# Altium project V3_Board.PrjPcb (part 8 of 9)

## Sheet Sensor_Section.SchDoc
size A4; DocumentNumber: 13; SheetNumber: 13; SheetTotal: 17
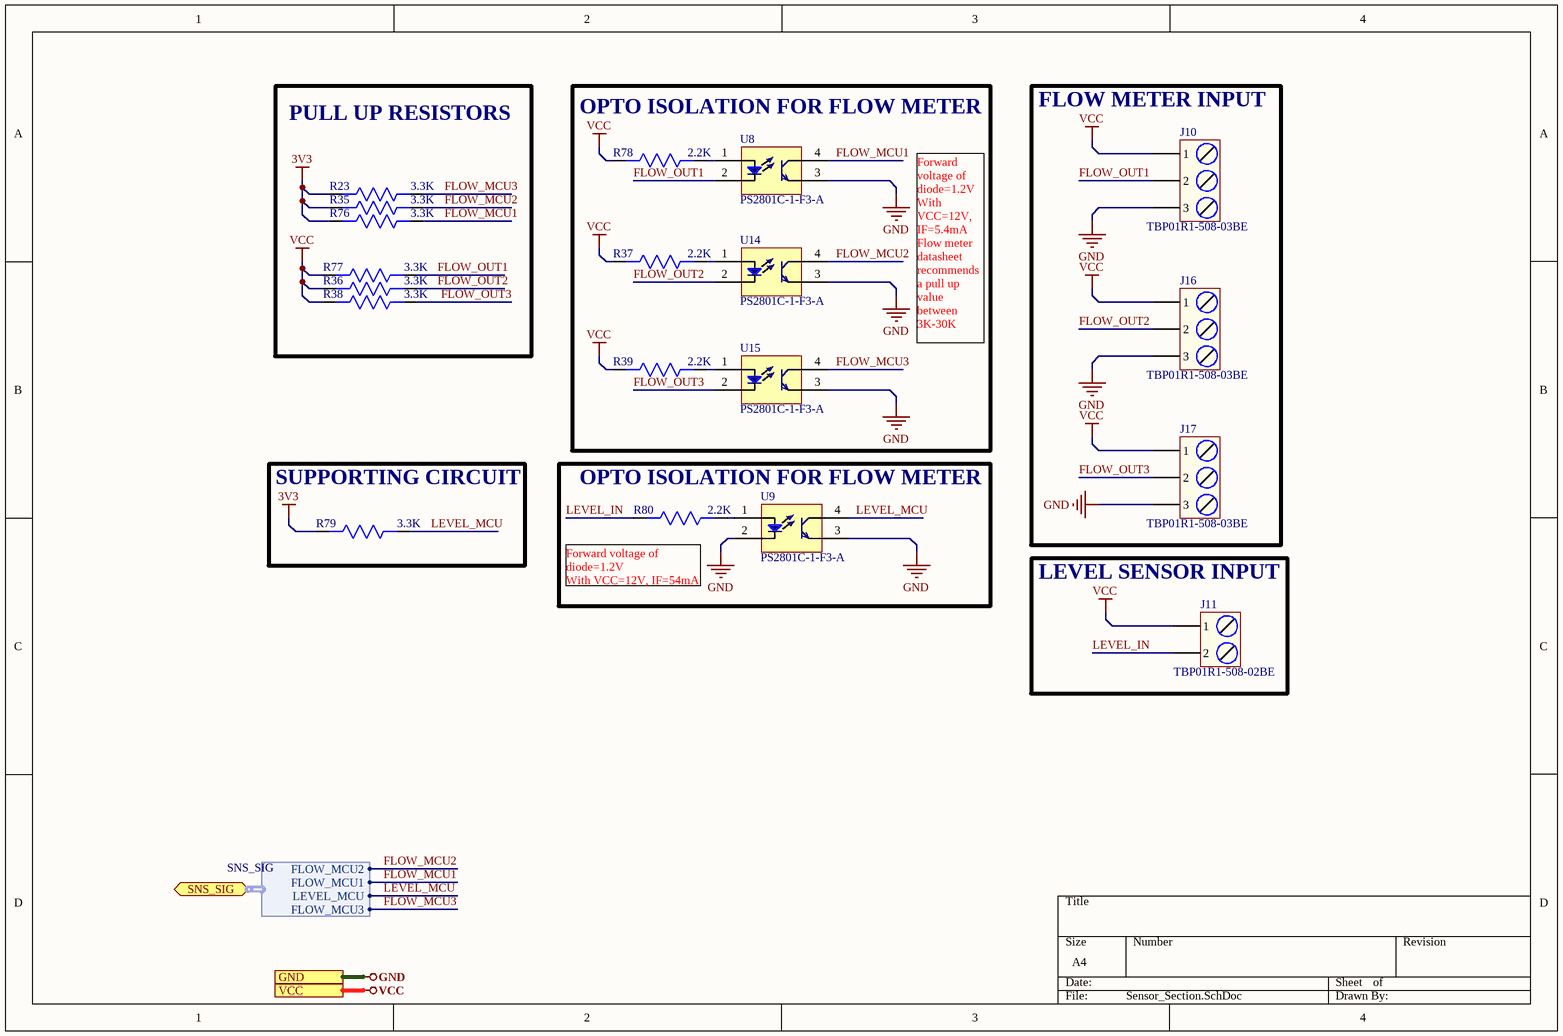
[diagram p15: Sensor_Section.SchDoc]

### Parts
J10  TBP01R1-508-03BE  [TBP01R1-508-03BE]
J11  TBP01R1-508-02BE  [TBP01R1-508-02BE]
J16  TBP01R1-508-03BE  [TBP01R1-508-03BE]
J17  TBP01R1-508-03BE  [TBP01R1-508-03BE]
R23  3.3K  [RES-0603]
R35  3.3K  [RES-0603]
R36  3.3K  [RES-0603]
R37  2.2K  [Res-0603]
R38  3.3K  [Res-0603]
R39  2.2K  [Res-0603]
R76  3.3K  [RES-0603]
R77  3.3K  [RES-0603]
R78  2.2K  [Res-0603]
R79  3.3K  [RES-0603]
R80  2.2K  [Res-0603]
U8  PS2801C-1-F3-A  [PS2801C-1-F3-A]
U9  PS2801C-1-F3-A  [PS2801C-1-F3-A]
U14  PS2801C-1-F3-A  [PS2801C-1-F3-A]
U15  PS2801C-1-F3-A  [PS2801C-1-F3-A]

### Blocks framed on the sheet
PULL UP RESISTORS: R23 R35 R36 R38 R76 R77
OPTO ISOLATION FOR FLOW METER: R37 R39 R78 U8 U14 U15
FLOW METER INPUT: J10 J16 J17
SUPPORTING CIRCUIT: R79
OPTO ISOLATION FOR FLOW METER: R80 U9
LEVEL SENSOR INPUT: J11

### Ports
GND, SNS_SIG (bidir, harness SNS_SIG), VCC

### Harnesses
SNS_SIG: FLOW_MCU1, LEVEL_MCU, FLOW_MCU2, FLOW_MCU3

### Nets
3V3: R23.2 R35.2 R76.2 R79.2
GND: J10.3 J16.3 J17.3 U8.3(E) U9.2(Ca) U9.3(E) U14.3(E) U15.3(E) ; port GND
VCC: J10.1 J11.1 J16.1 J17.1 R36.2 R37.2 R38.2 R39.2 R77.2 R78.2 ; port VCC
FLOW_MCU1: R76.1 U8.4(C) ; port SNS_SIG.FLOW_MCU1
FLOW_MCU2: R35.1 U14.4(C) ; port SNS_SIG.FLOW_MCU2
FLOW_MCU3: R23.1 U15.4(C) ; port SNS_SIG.FLOW_MCU3
FLOW_OUT1: J10.2 R77.1 U8.2(Ca)
FLOW_OUT2: J16.2 R36.1 U14.2(Ca)
FLOW_OUT3: J17.2 R38.1 U15.2(Ca)
LEVEL_IN: J11.2 R80.2
LEVEL_MCU: R79.1 U9.4(C) ; port SNS_SIG.LEVEL_MCU
NetR37_1: R37.1 U14.1(An)
NetR39_1: R39.1 U15.1(An)
NetR78_1: R78.1 U8.1(An)
NetR80_1: R80.1 U9.1(An)

### Notes on the sheet
- Forward voltage of diode=1.2V
  With VCC=12V, IF=5.4mA
  Flow meter datasheet recommends a pull up value between 3K-30K
- (near R80) Forward voltage of diode=1.2V
  With VCC=12V, IF=54mA

### Library data of the parts
J10 J16 J17 = TBP01R1-508-03BE: TERMINAL BLOCK, PLUGGABLE, 5.08,; Manufacturer: CUI Devices; Supplier 1: Arrow Electronics; Manufacturer Part Number: TBP01R1-508-03BE; RoHS: Yes; Category: Terminal Blocks; Stock 1: 2069; Pricing 1: 1=0.52380, 10=0.21370, 100=0.18450, 600=0.17070 (USD); Supplier Part Number 1: TBP01R1-508-03BE
J11 = TBP01R1-508-02BE: TERMINAL BLOCK, PLUGGABLE, 5.08,; Manufacturer: CUI Devices; Supplier 1: Arrow Electronics; Manufacturer Part Number: TBP01R1-508-02BE; RoHS: Yes; Category: Terminal Blocks; Stock 1: 1821; Pricing 1: 1=0.57450, 10=0.23530, 25=0.18730, 50=0.17170, 100=0.16040, 400=0.14010, 800=0.12060, 1200=0.11290 (USD); Supplier Part Number 1: TBP01R1-508-02BE
R23 R35 R36 R38 R76 R77 R79 = RC0603FR-073K3L: RES SMD 3.3K OHM 1% 1/10W 0603; Manufacturer: Yageo Phycomp; Temperature Coefficient: 100ppm/°C; Resistance: 3.3kR; Voltage Rating (DC): 50V; Power Rating: 100mW; Supplier 1: Digi-Key; Manufacturer Part Number: RC0603FR-073K3L; Stock 1: 6863000; Pricing 1: 1=0.1, 10=0.024, 100=0.0097, 1000=0.00437, 2500=0.00379 (USD); Mount: Surface Mount; Case/Package: 0603; Number of Pins: 2; Min Operating Temperature: -55°C; Max Operating Temperature: 155°C; Tolerance: 1%; Packaging: Cut Tape; Length: 1.6mm; Height: 0.45mm; Width: 800um; Depth: 0.8mm; REACH SVHC: No SVHC; Lead Free: Lead Free; Supplier Part Number 1: 311-3.30KHRCT-ND
  R38: LCSC Part Number: C108078
R37 R39 R78 R80 = RC0603FR-072K2L: RES 2.2K OHM 1% 1/10W 0603; Manufacturer: Yageo; Resistance: 2.2kR; Temperature Coefficient: 100ppm/°C; Power Rating: 100mW; Voltage Rating: 50V; Supplier 1: Digi-Key; Manufacturer Part Number: RC0603FR-072K2L; RoHS: Yes; Category: Chip SMD Resistors; Stock 1: 2808901; Pricing 1: 1=0.10000, 10=0.02100, 100=0.00850, 1000=0.00383, 2500=0.00332 (USD); Case/Package: 0603; Case Code (Imperial): 0603; Case Code (Metric): 1608; Size Code: 0603; Min Operating Temperature: -55°C; Max Operating Temperature: 155°C; Tolerance: 1%; Packaging: Tape and Reel; Resistor Type: Thick Film; Package Quantity: 1; Termination: SMD/SMT; Number of Terminations: 2; Max Power Dissipation: 100mW; Features: Moisture Resistant; Series: RC; Resistance Tolerance: 1%; Construction: Rectangular; Length: 1.6mm; Width: 0.031inch; Height: 0.022inch; Depth: 0.8mm; Lead Free: Lead Free; Military Standard: Not; RoHS Compliant: Yes; Supplier Part Number 1: 311-2.20KHRCT-ND
U8 U9 U14 U15 = PS2801C-1-F3-A: TransistorOptocouplers DC 1 2500Vrms SOP-4_P1.27 Optocouplers RoHS; Manufacturer: CEL; Number of Channels: 1; Collector Emitter Voltage (VCEO): 300mV; Forward Voltage: 1.2V; Max Power Dissipation: 120mW; Max Collector Current: 30mA; Max Output Voltage: 80V; Supplier 1: Digi-Key; Manufacturer Part Number: PS2801C-1-F3-A; Stock 1: 399; Pricing 1: 1=0.77, 10=0.595, 100=0.3825 (USD); Mount: Surface Mount; Case/Package: SOIC; Number of Pins: 4; Min Operating Temperature: -55°C; Max Operating Temperature: 100°C; Packaging: Tape and Reel; Collector Emitter Saturation Voltage: 300mV; Package Quantity: 1; Output Current per Channel: 30mA; Lead Free: Lead Free; ComponentLink1URL: http://www.cel.com/pdf/datasheets/PS2801C-1,PS2801C-4.pdf?src-supplier=Digi-Key; ComponentLink1Description: http://www.cel.com/pdf/datasheets/PS2801C-1,PS2801C-4.pdf?src-supplier=Digi-Key; ComponentLink2URL: http://www.cel.com/pdf/datasheets/how_to_order_optos.pdf?src-supplier=Digi-Key; ComponentLink2Description: http://www.cel.com/pdf/datasheets/how_to_order_optos.pdf?src-supplier=Digi-Key; ComponentLink3URL: http://datasheet.iiic.cc/cel/PS2801C-1-F3-A.pdf?src-supplier=IIIC; ComponentLink3Description: http://datasheet.iiic.cc/cel/PS2801C-1-F3-A.pdf?src-supplier=IIIC; Supplier Part Number 1: PS2801C-1-F3-ACT-ND

## Sheet LED_Section.SchDoc
size A4; DocumentNumber: 14; SheetNumber: 14; SheetTotal: 17
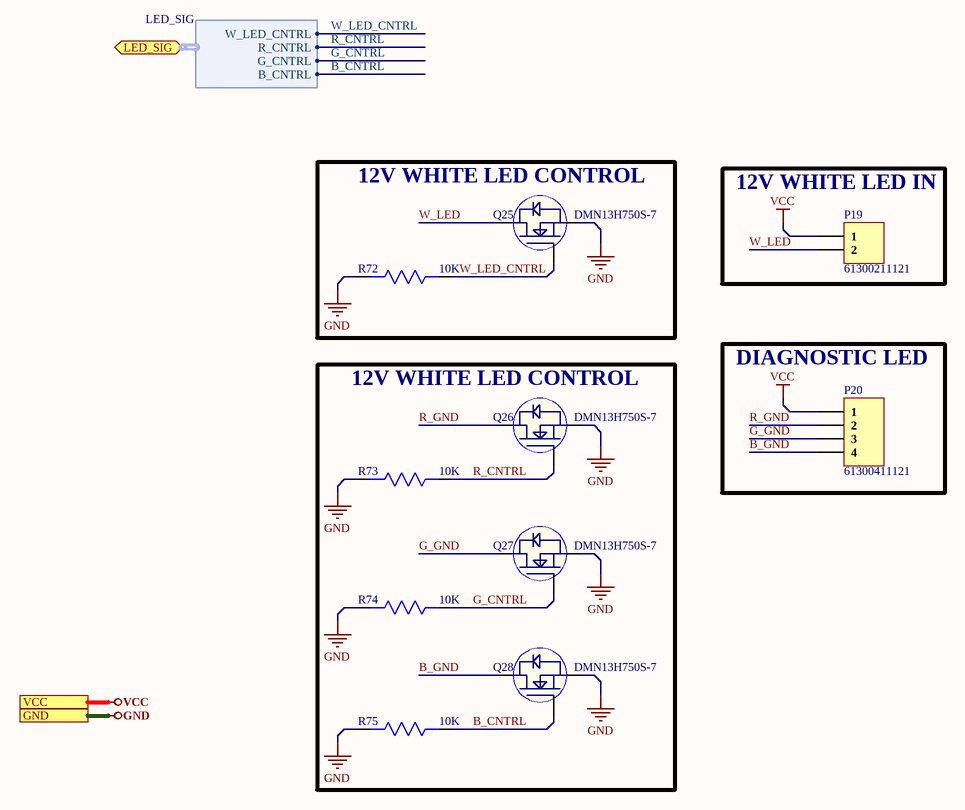
[diagram p16: LED_Section.SchDoc]

### Parts
P19  61300211121  [HDR1X2]
P20  61300411121  [HDR1X4]
Q25  DMN13H750S-7  [SOT23-3]
Q26  DMN13H750S-7  [SOT23-3]
Q27  DMN13H750S-7  [SOT23-3]
Q28  DMN13H750S-7  [SOT23-3]
R72  10K  [Res-0603]
R73  10K  [Res-0603]
R74  10K  [RES-0603]
R75  10K  [Res-0603]

### Blocks framed on the sheet
12V WHITE LED CONTROL: Q25 R72
12V WHITE LED IN: P19
12V WHITE LED CONTROL: Q26-Q28 R73-R75
DIAGNOSTIC LED: P20

### Ports
GND, LED_SIG (bidir, harness LED_SIG), VCC

### Harnesses
LED_SIG: R_CNTRL, G_CNTRL, B_CNTRL, W_LED_CNTRL

### Nets
GND: Q25.2(S) Q26.2(S) Q27.2(S) Q28.2(S) R72.2 R73.2 R74.2 R75.2 ; port GND
VCC: P19.1 P20.1 ; port VCC
B_CNTRL: Q28.1(G) R75.1 ; port LED_SIG.B_CNTRL
B_GND: P20.4 Q28.3(D)
G_CNTRL: Q27.1(G) R74.1 ; port LED_SIG.G_CNTRL
G_GND: P20.3 Q27.3(D)
R_CNTRL: Q26.1(G) R73.1 ; port LED_SIG.R_CNTRL  [project net LED_SIG.R_CNTRL]
R_GND: P20.2 Q26.3(D)
W_LED: P19.2 Q25.3(D)
W_LED_CNTRL: Q25.1(G) R72.1 ; port LED_SIG.W_LED_CNTRL  [project net LED_SIG.W_LED_CNTRL]

### Library data of the parts
P19 = Header 1x2: CONN HEADER VERT 2POS 2.54MM; Manufacturer: Wurth Electronics; Current Rating: 3A; Voltage Rating: 250V; Number of Positions: 2; Gender: Male; Connector Type: Male Pin; Pitch: 0.1inch; Supplier 1: Digi-Key; Manufacturer Part Number: 61300211121; Stock 1: 219205; Pricing 1: 1=0.13, 10=0.106, 25=0.088, 50=0.074, 100=0.067, 1000=0.061 (USD); Mount: Through Hole; Contact Plating: Gold; Housing Material: PBT; Contact Material: Copper Alloy,Copper; Color: Black; Min Operating Temperature: -40°C; Max Operating Temperature: 125°C; Number of Rows: 1; Contact Gender: Male; Packaging: Bulk; Termination: Through Hole; Number of Contacts: 2; Contact Mating Length: 0.236inch; REACH SVHC: Unknown; Lead Free: Lead Free; ComponentLink1URL: http://www.mouser.com/ds/2/445/6130xx11121-538006.pdf?src-supplier=Mouser; ComponentLink1Description: http://www.mouser.com/ds/2/445/6130xx11121-538006.pdf?src-supplier=Mouser; Supplier Part Number 1: 732-5315-ND
P20 = Header 1x4: CONN HEADER VERT 4POS 2.54MM; Manufacturer: Wurth Electronics; Number of Positions: 4; Gender: Male; Connector Type: Male Pin; Pitch: 0.1inch; Supplier 1: Digi-Key; Manufacturer Part Number: 61300411121; Stock 1: 20544; Pricing 1: 1=0.18, 10=0.153, 25=0.1272, 50=0.106, 100=0.096, 1000=0.088 (USD); Mount: Through Hole; Contact Plating: Gold; Contact Material: Copper; Color: Black; Number of Rows: 1; Packaging: Bulk; Termination: Solder; Number of Contacts: 4; Contact Mating Length: 0.236inch; REACH SVHC: Unknown; Lead Free: Lead Free; ComponentLink1URL: http://www.farnell.com/cad/1737268.pdf?src-supplier=Element14; ComponentLink1Description: http://www.farnell.com/cad/1737268.pdf?src-supplier=Element14; ComponentLink2URL: https://katalog.we-online.de/em/datasheet/6130xx11121.pdf?src-supplier=Digi-Key; ComponentLink2Description: https://katalog.we-online.de/em/datasheet/6130xx11121.pdf?src-supplier=Digi-Key; Supplier Part Number 1: 732-5317-ND
Q25-Q28 = DMN13H750S-7: MOSFET N-CH 130V 1A SOT23; Manufacturer: Diodes; Rds On Max: 750mR; Input Capacitance: 231pF; Max Power Dissipation: 770mW; Supplier 1: Digi-Key; Manufacturer Part Number: DMN13H750S-7; Stock 1: 5815; Pricing 1: 1=0.53, 10=0.455, 25=0.4244, 100=0.3151, 250=0.29936, 500=0.24604, 1000=0.19998 (USD); Mount: Surface Mount; Case/Package: TO-236-3; Min Operating Temperature: -55°C; Max Operating Temperature: 150°C; Packaging: Tape and Reel; Drain to Source Voltage (Vdss): 130V; Continuous Drain Current (ID): 1A; ComponentLink1URL: https://www.diodes.com/assets/Datasheets/DMN13H750S.pdf?src-supplier=Digi-Key; ComponentLink1Description: https://www.diodes.com/assets/Datasheets/DMN13H750S.pdf?src-supplier=Digi-Key; ComponentLink2URL: http://www.mouser.com/ds/2/115/DMN13H750S-526254.pdf?src-supplier=Mouser; ComponentLink2Description: http://www.mouser.com/ds/2/115/DMN13H750S-526254.pdf?src-supplier=Mouser; Supplier Part Number 1: DMN13H750S-7DICT-ND
R72 R73 R75 = RC0603FR-0710KL: RES SMD 10K Ohm 1% 1/10W 0603; Manufacturer: Yageo; Voltage Rating: 75V; Resistance: 10kR; Power Rating: 100mW; Temperature Coefficient: 100ppm/°C; Voltage Rating (DC): 50V; Supplier 1: Digi-Key; Manufacturer Part Number: RC0603FR-0710KL; RoHS: Yes; Category: Chip SMD Resistors; Stock 1: 25249139; Pricing 1: 1=0.10000, 10=0.02400, 100=0.00970, 1000=0.00436, 2500=0.00378 (USD); Case/Package: 0603; Case Code (Imperial): 0603; Case Code (Metric): 1608; Size Code: 0603; Min Operating Temperature: -55°C; Max Operating Temperature: 155°C; Packaging: Tape and Reel; Tolerance: 1%; Resistor Type: Thick Film; Termination: SMD/SMT; Number of Terminations: 2; Max Power Dissipation: 100mW; Features: Moisture Resistant; Series: RC; Construction: Rectangular; Length: 1.6mm; Width: 0.8mm; Height: 0.45mm; Depth: 0.8mm; Military Standard: Not; Lead Free: Lead Free; RoHS Compliant: Yes; ComponentLink1URL: https://datasheet.ciiva.com/7660/38590-7660789.pdf?src-supplier=Element14; ComponentLink1Description: https://datasheet.ciiva.com/7660/38590-7660789.pdf?src-supplier=Element14; Supplier Part Number 1: 311-10.0KHRCT-ND; Number of Pins: 2; Weight: 7.1E-05oz; Resistance Tolerance: 1%; Lead Pitch: 0.3mm; REACH SVHC: Unknown; ComponentLink2URL: https://datasheet.ciiva.com/7983/443971-7983596.pdf?src-supplier=Element14; ComponentLink2Description: https://datasheet.ciiva.com/7983/443971-7983596.pdf?src-supplier=Element14; ComponentLink3URL: https://datasheet.ciiva.com/22747/443971-22747519.pdf?src-supplier=Element14; ComponentLink3Description: https://datasheet.ciiva.com/22747/443971-22747519.pdf?src-supplier=Element14; ComponentLink4URL: https://datasheet.ciiva.com/46440/1868787-46440891.pdf?src-supplier=Element14; ComponentLink4Description: https://datasheet.ciiva.com/46440/1868787-46440891.pdf?src-supplier=Element14; ComponentLink5URL: https://datasheet.ciiva.com/7746/1738695-7746239.pdf?src-supplier=Element14; ComponentLink5Description: https://datasheet.ciiva.com/7746/1738695-7746239.pdf?src-supplier=Element14; ComponentLink6URL: https://datasheet.ciiva.com/15189/getdatasheetpartid-409289-15189591.pdf?src-supplier=Verical; ComponentLink6Description: https://datasheet.ciiva.com/15189/getdatasheetpartid-409289-15189591.pdf?src-supplier=Verical; LCSC Part Number: C98220
R74 = AC0603JR-0710KL: RES SMD 10K OHM 5% 1/10W 0603; Manufacturer: Yageo; Voltage Rating: 50V; Resistance: 10kR; Power Rating: 100mW; Temperature Coefficient: 100ppm/°C; Supplier 1: Future Electronics; Manufacturer Part Number: AC0603JR-0710KL; RoHS: Yes; Category: Chip SMD Resistors; Stock 1: 1533000; Pricing 1: 5000=0.00540 (USD); Case/Package: 0603; Case Code (Imperial): 0603; Case Code (Metric): 1608; Size Code: 0603; Min Operating Temperature: -55°C; Max Operating Temperature: 155°C; Packaging: Tape and Reel; Tolerance: 5%; Package Quantity: 1; Resistor Type: Thick Film; Termination: SMD/SMT; Number of Terminations: 2; Max Power Dissipation: 100mW; Features: Moisture Resistant,Automotive AEC-Q200,Anti-Sulfur; Series: AC; Construction: Rectangular; Length: 0.063inch; Width: 0.031inch; Height: 0.022inch; Depth: 0.8mm; Military Standard: Not; Lead Free: Lead Free; RoHS Compliant: Yes; ComponentLink1URL: https://datasheet.ciiva.com/5562/pyu-ac-51-rohs-l-2-5562553.pdf?src-supplier=Mouser; ComponentLink1Description: https://datasheet.ciiva.com/5562/pyu-ac-51-rohs-l-2-5562553.pdf?src-supplier=Mouser; Supplier Part Number 1: 1029044

## Sheet Valve_Section.SchDoc
size A; DocumentNumber: 12; SheetNumber: 12; SheetTotal: 17
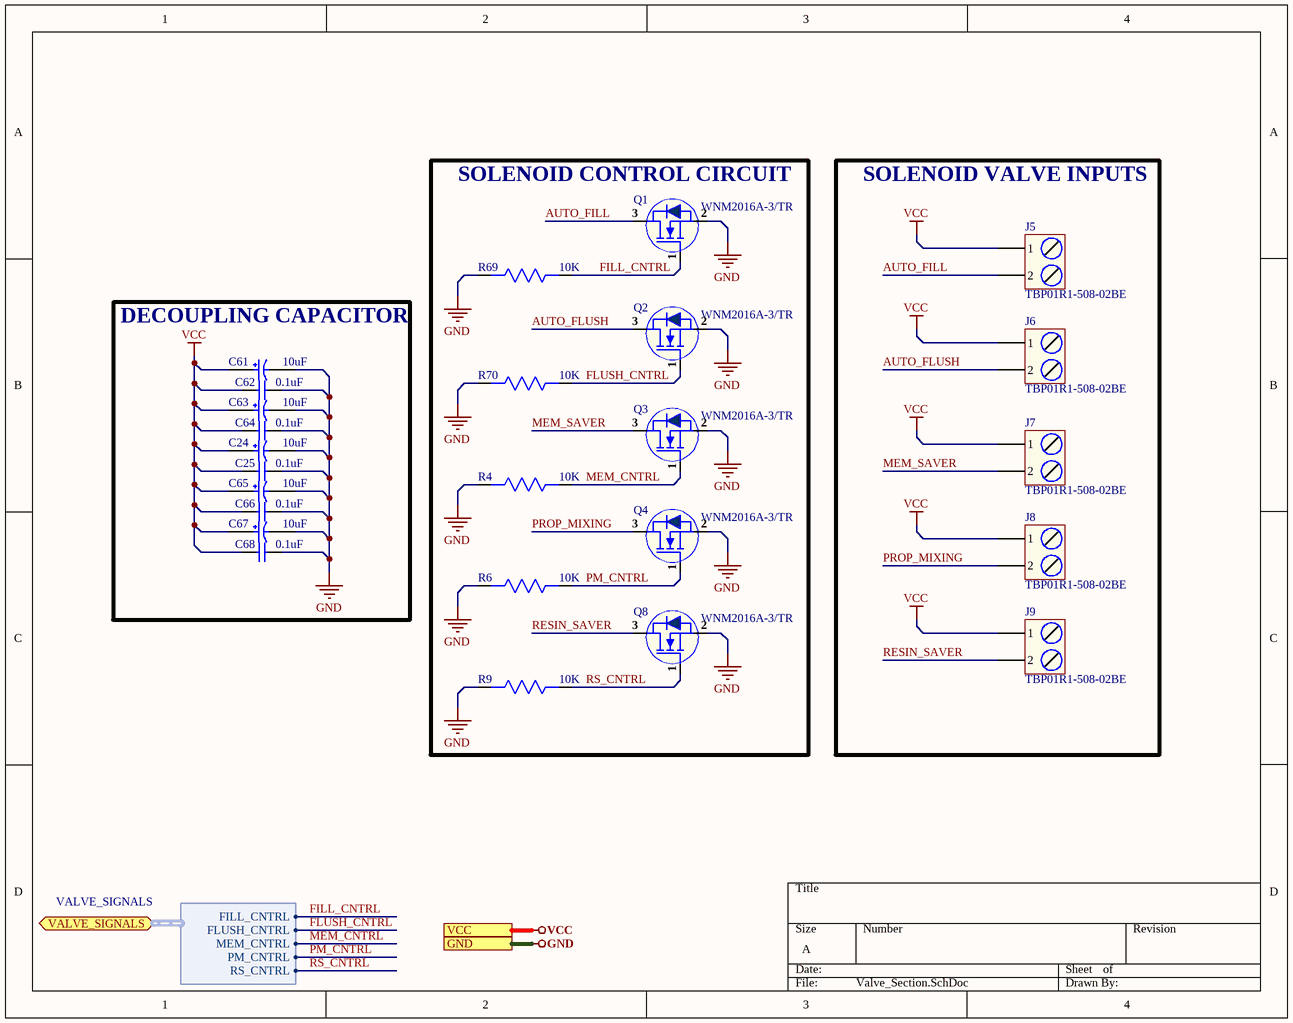
[diagram p17: Valve_Section.SchDoc]

### Parts
C24  10uF  [RVT1E100M0405.]
C25  0.1uF  [Cap0603]
C61  10uF  [RVT1E100M0405.]
C62  0.1uF  [Cap0603]
C63  10uF  [RVT1E100M0405.]
C64  0.1uF  [Cap0603]
C65  10uF  [RVT1E100M0405.]
C66  0.1uF  [Cap0603]
C67  10uF  [RVT1E100M0405.]
C68  0.1uF  [Cap0603]
J5  TBP01R1-508-02BE  [TBP01R1-508-02BE]
J6  TBP01R1-508-02BE  [TBP01R1-508-02BE]
J7  TBP01R1-508-02BE  [TBP01R1-508-02BE]
J8  TBP01R1-508-02BE  [TBP01R1-508-02BE]
J9  TBP01R1-508-02BE  [TBP01R1-508-02BE]
Q1  WNM2016A-3/TR  [sot-23]
Q2  WNM2016A-3/TR  [sot-23]
Q3  WNM2016A-3/TR  [sot-23]
Q4  WNM2016A-3/TR  [sot-23]
Q8  WNM2016A-3/TR  [sot-23]
R4  10K  [Res-0603]
R6  10K  [Res-0603]
R9  10K  [Res-0603]
R69  10K  [Res-0603]
R70  10K  [Res-0603]

### Blocks framed on the sheet
SOLENOID CONTROL CIRCUIT: Q1-Q4 Q8 R4 R6 R9 R69 R70
SOLENOID VALVE INPUTS: J5-J9
DECOUPLING CAPACITOR: C24 C25 C61-C68

### Ports
GND, VALVE_SIGNALS (bidir, harness VALVE_SIGNALS), VCC

### Harnesses
VALVE_SIGNALS: FILL_CNTRL, FLUSH_CNTRL, MEM_CNTRL, PM_CNTRL, RS_CNTRL

### Nets
GND: C24.2 C25.2 C61.2 C62.2 C63.2 C64.2 C65.2 C66.2 C67.2 C68.2 Q1.2(S) Q2.2(S) Q3.2(S) Q4.2(S) Q8.2(S) R4.2 R6.2 R9.2 R69.2 R70.2 ; port GND
VCC: C24.1 C25.1 C61.1 C62.1 C63.1 C64.1 C65.1 C66.1 C67.1 C68.1 J5.1 J6.1 J7.1 J8.1 J9.1 ; port VCC
AUTO_FILL: J5.2 Q1.3(D)
AUTO_FLUSH: J6.2 Q2.3(D)
FILL_CNTRL: Q1.1(G) R69.1 ; port VALVE_SIGNALS.FILL_CNTRL
FLUSH_CNTRL: Q2.1(G) R70.1 ; port VALVE_SIGNALS.FLUSH_CNTRL
MEM_CNTRL: Q3.1(G) R4.1 ; port VALVE_SIGNALS.MEM_CNTRL
MEM_SAVER: J7.2 Q3.3(D)
PM_CNTRL: Q4.1(G) R6.1 ; port VALVE_SIGNALS.PM_CNTRL
PROP_MIXING: J8.2 Q4.3(D)
RESIN_SAVER: J9.2 Q8.3(D)
RS_CNTRL: Q8.1(G) R9.1 ; port VALVE_SIGNALS.RS_CNTRL

### Library data of the parts
C24 C61 C63 C65 C67 = RVT1E100M0405: CAP ALUM 10uF 25V SMD; Manufacturer: ROQANG; φD: 4mm; L: 5.4mm; Tolerance: ±20%; Operating Temperature: -45℃~+105℃; Rated Voltage: 25V; Capacitance: 10uF
C25 C62 C64 C66 C68 = CC0603ZRY5V9BB104: as C27-C30 on sheet Controller_Section; Supplier 1: Digi-Key; Manufacturer Part Number: CC0603ZRY5V9BB104; Stock 1: 15000880; Pricing 1: 1=0.1, 10=0.075, 100=0.0334, 500=0.02386, 1000=0.01874 (USD); Mount: Surface Mount; Case/Package: 0603; Number of Pins: 2; Case Code (Metric): 1608; Case Code (Imperial): 0603; Min Operating Temperature: -30°C; Max Operating Temperature: 85°C; Dielectric: Y5V; Voltage Rating: 50V; Package Quantity: 1; Packaging: Tape and Reel; Voltage Rating (DC): 50V; Termination: SMD/SMT; Composition: Ceramic; Voltage: 50V; Length: 1.6mm; Height: 0.8mm; Width: 0.031inch; Thickness: 0.035inch; Depth: 0.8mm; Radiation Hardening: No; REACH SVHC: No SVHC; Lead Free: Lead Free; Halogen Free: Halogen Free; ComponentLink1URL: http://www.yageo.com/documents/recent/UPY-GPHC_Y5V_6.3V-to-50V_8.pdf?src-supplier=Digi-Key; ComponentLink1Description: http://www.yageo.com/documents/recent/UPY-GPHC_Y5V_6.3V-to-50V_8.pdf?src-supplier=Digi-Key; ComponentLink2URL: http://www.yageo.com/documents/recent/UPY-GPHC_Y5V_6.3V-to-50V_5.pdf?src-supplier=Avnet+Europe; ComponentLink2Description: http://www.yageo.com/documents/recent/UPY-GPHC_Y5V_6.3V-to-50V_5.pdf?src-supplier=Avnet+Europe; ComponentLink3URL: https://www.verical.com/server-webapp/html/getDatasheet?partID=403611&src-supplier=Verical; ComponentLink3Description: https://www.verical.com/server-webapp/html/getDatasheet?partID=403611&src-supplier=Verical; ComponentLink4URL: http://www.mouser.com/ds/2/447/Yageo_UPY-GP_NP0_16V-to-50V_9-358835.pdf?src-supplier=Mouser; ComponentLink4Description: http://www.mouser.com/ds/2/447/Yageo_UPY-GP_NP0_16V-to-50V_9-358835.pdf?src-supplier=Mouser; ComponentLink5URL: http://www.farnell.com/datasheets/1132289.pdf?src-supplier=Element14; ComponentLink5Description: http://www.farnell.com/datasheets/1132289.pdf?src-supplier=Element14; Supplier Part Number 1: 311-1343-1-ND
J5-J9 = TBP01R1-508-02BE: as J11 on sheet Sensor_Section; Supplier 1: Arrow Electronics; Manufacturer Part Number: TBP01R1-508-02BE; RoHS: Yes; Category: Terminal Blocks; Stock 1: 1821; Pricing 1: 1=0.57450, 10=0.23530, 25=0.18730, 50=0.17170, 100=0.16040, 400=0.14010, 800=0.12060, 1200=0.11290 (USD); Supplier Part Number 1: TBP01R1-508-02BE
Q1-Q4 Q8 = WNM2016A-3/TR: Single N-Channel, 20V, 4.7A, Power MOSFET; Manufacturer: WILLSEMI; Manufacturer Part Number: WNM2016A-3/TR; Footprint: SOT-23-3; ComponentLink1Description: LCSC; ComponentLink1URL: https://www.lcsc.com/product-detail/MOSFETs_WILLSEMI-Will-Semicon-WNM2016A-3-TR_C601105.html; LCSC Part Number: C601105; Item Type: Mosfet
R4 R6 R9 R69 R70 = RC0603FR-0710KL: as R72 on sheet LED_Section; Supplier 1: Digi-Key; Manufacturer Part Number: RC0603FR-0710KL; RoHS: Yes; Category: Chip SMD Resistors; Stock 1: 25249139; Pricing 1: 1=0.10000, 10=0.02400, 100=0.00970, 1000=0.00436, 2500=0.00378 (USD); Case/Package: 0603; Case Code (Imperial): 0603; Case Code (Metric): 1608; Size Code: 0603; Min Operating Temperature: -55°C; Max Operating Temperature: 155°C; Packaging: Tape and Reel; Tolerance: 1%; Resistor Type: Thick Film; Termination: SMD/SMT; Number of Terminations: 2; Max Power Dissipation: 100mW; Features: Moisture Resistant; Series: RC; Construction: Rectangular; Length: 1.6mm; Width: 0.8mm; Height: 0.45mm; Depth: 0.8mm; Military Standard: Not; Lead Free: Lead Free; RoHS Compliant: Yes; ComponentLink1URL: https://datasheet.ciiva.com/7660/38590-7660789.pdf?src-supplier=Element14; ComponentLink1Description: https://datasheet.ciiva.com/7660/38590-7660789.pdf?src-supplier=Element14; Supplier Part Number 1: 311-10.0KHRCT-ND; Number of Pins: 2; Weight: 7.1E-05oz; Resistance Tolerance: 1%; Lead Pitch: 0.3mm; REACH SVHC: Unknown; ComponentLink2URL: https://datasheet.ciiva.com/7983/443971-7983596.pdf?src-supplier=Element14; ComponentLink2Description: https://datasheet.ciiva.com/7983/443971-7983596.pdf?src-supplier=Element14; ComponentLink3URL: https://datasheet.ciiva.com/22747/443971-22747519.pdf?src-supplier=Element14; ComponentLink3Description: https://datasheet.ciiva.com/22747/443971-22747519.pdf?src-supplier=Element14; ComponentLink4URL: https://datasheet.ciiva.com/46440/1868787-46440891.pdf?src-supplier=Element14; ComponentLink4Description: https://datasheet.ciiva.com/46440/1868787-46440891.pdf?src-supplier=Element14; ComponentLink5URL: https://datasheet.ciiva.com/7746/1738695-7746239.pdf?src-supplier=Element14; ComponentLink5Description: https://datasheet.ciiva.com/7746/1738695-7746239.pdf?src-supplier=Element14; ComponentLink6URL: https://datasheet.ciiva.com/15189/getdatasheetpartid-409289-15189591.pdf?src-supplier=Verical; ComponentLink6Description: https://datasheet.ciiva.com/15189/getdatasheetpartid-409289-15189591.pdf?src-supplier=Verical; LCSC Part Number: C98220

## Sheet HMI_Encoder_NFC_Sheet.SchDoc
size A4
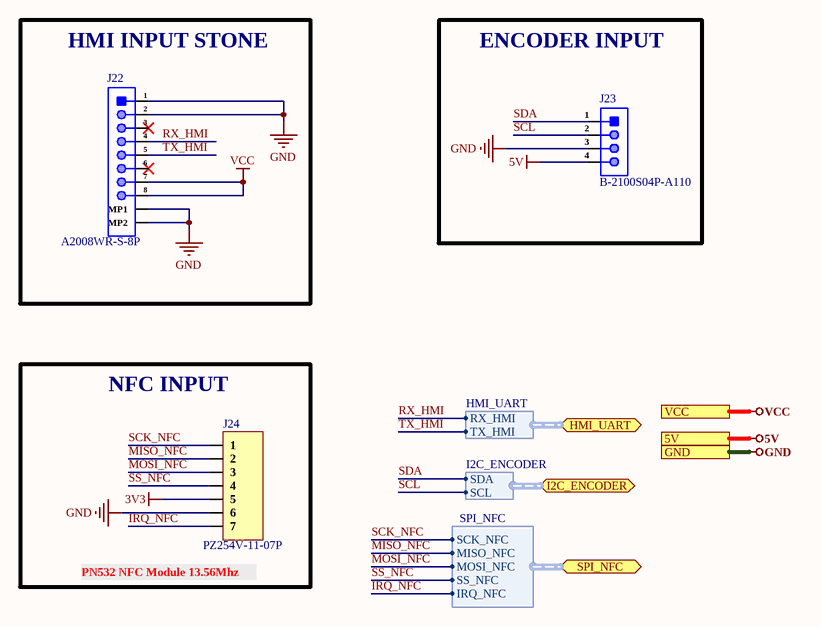
[diagram p18: HMI_Encoder_NFC_Sheet.SchDoc]

### Parts
J22  A2008WR-S-8P  [A2008WR-S-8P]
J23  B-2100S04P-A110  [HDR1X4_]
J24  PZ254V-11-07P  [HDR1X7]

### Blocks framed on the sheet
HMI INPUT STONE: J22
ENCODER INPUT: J23
NFC INPUT: J24

### Ports
5V, GND, HMI_UART (bidir, harness HMI_UART), I2C_ENCODER (bidir, harness I2C_ENCODER), SPI_NFC (bidir, harness SPI_NFC), VCC

### Harnesses
HMI_UART: RX_HMI, TX_HMI
I2C_ENCODER: SDA, SCL
SPI_NFC: MISO_NFC, MOSI_NFC, SS_NFC, IRQ_NFC, SCK_NFC

### Nets
3V3: J24.5
5V: J23.4 ; port 5V
GND: J22.1 J22.2 J22.MP1 J22.MP2 J23.3 J24.6 ; port GND
VCC: J22.7 J22.8 ; port VCC
IRQ_NFC: J24.7 ; port SPI_NFC.IRQ_NFC
MISO_NFC: J24.2 ; port SPI_NFC.MISO_NFC
MOSI_NFC: J24.3 ; port SPI_NFC.MOSI_NFC
RX_HMI: J22.4 ; port HMI_UART.RX_HMI  [project net HMI_UART.RX_HMI]
SCK_NFC: J24.1 ; port SPI_NFC.SCK_NFC
SCL: J23.2 ; port I2C_ENCODER.SCL  [project net I2C_ENCODER.SCL]
SDA: J23.1 ; port I2C_ENCODER.SDA  [project net I2C_ENCODER.SDA]
SS_NFC: J24.4 ; port SPI_NFC.SS_NFC  [project net SPI_NFC.SS_NFC]
TX_HMI: J22.5 ; port HMI_UART.TX_HMI  [project net HMI_UART.TX_HMI]

Not connected (* = marked no-connect by the designer): J22 3* 6*

### Notes on the sheet
- (near J24) PN532 NFC Module 13.56Mhz

### Library data of the parts
J22 = A2008WR-S-8P: 1x8P PH 1 2mm 8 Brass SMD,P=2mm Wire To Board / Wire To Wire Connector ROHS; Manufacturer: CJT; Manufacturer Part Number: A2008WR-S-8P; Package: SMD,P=2mm; LCSC Part Number: C273136; Item Type: Wire To Wire Connector; ComponentLink1Description: LCSC; ComponentLink1URL: https://www.lcsc.com/product-detail/_Changjiang-Connectors-A2008WR-S-8P_C273136.html
J23 = B-2100S04P-A110: Straight 2.54mm Black Brass 1x4P Plugin,P=2.54mm Pin Headers ROHS; Manufacturer: Ckmtw; Item Type: Header; LCSC Part Number: C124378; Manufacturer Part Number: B-2100S04P-A110; ComponentLink1Description: LCSC; ComponentLink1URL: https://www.lcsc.com/product-detail/Pin-Headers_Ckmtw-Shenzhen-Cankemeng-B-2100S04P-A110_C124378.html
J24 = PZ254V-11-07P: Straight Square Pins 2.5mm 7P 6mm -40℃~+105℃ 3mm 2.54mm Plugin Black Brass 1x7P Plugin,P=2.54mm Pin Headers ROHS; Manufacturer: XFCN; Item Type: Male Header; Manufacturer Part Number: PZ254V-11-07P; Package: Plugin,P=2.54mm; LCSC Part Number: C492406; ComponentLink1Description: LCSC; ComponentLink1URL: https://www.lcsc.com/product-detail/span-style-background-color-ff0-Pin-span-Headers_XFCN-PZ254V-11-07P_C492406.html

## Sheet Ultra_Sonic_Section.SchDoc
size A
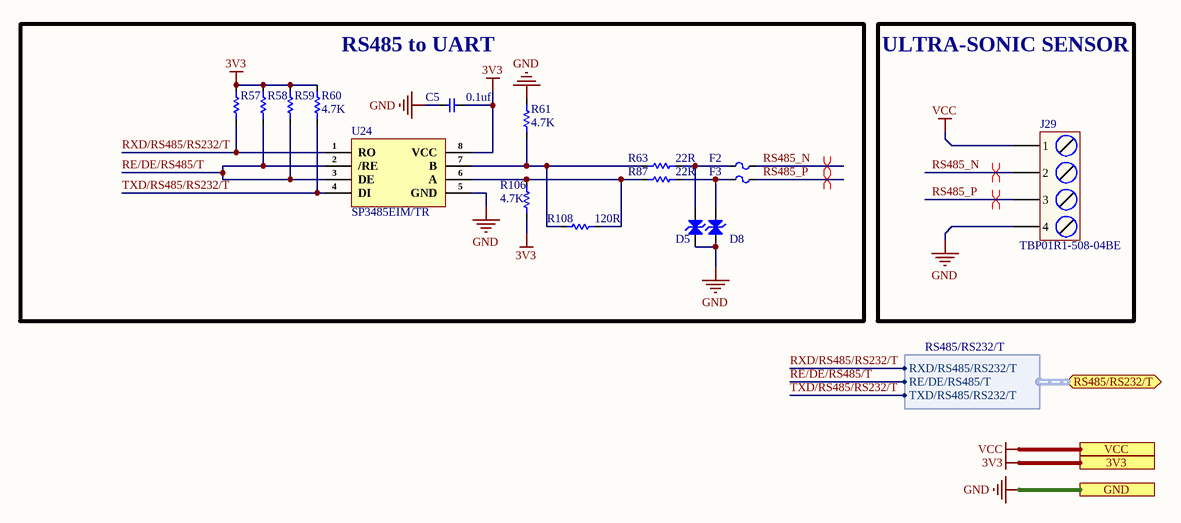
[diagram p19: Ultra_Sonic_Section.SchDoc]

### Parts
C5  0.1uf  [Cap-0402]
D5  SMBJ26CA  [SMB_]  (value not drawn)
D8  SMBJ26CA  [SMB_]  (value not drawn)
F2  SMD0805P020TF  [Fuse-0805]  (value not drawn)
F3  SMD0805P020TF  [Fuse-0805]  (value not drawn)
J29  TBP01R1-508-04BE  [TBP01R1-508-04BE]
R57  4.7K  [Res-0402]  (value not drawn)
R58  4.7K  [Res-0402]  (value not drawn)
R59  4.7K  [Res-0402]  (value not drawn)
R60  4.7K  [Res-0402]
R61  4.7K  [Res-0402]
R63  22R  [Res-0402]
R87  22R  [Res-0402]
R106  4.7K  [Res-0402]
R108  120R  [Res-0603]
U24  SP3485EIM/TR  [SOP-8]

### Blocks framed on the sheet
RS485 to UART: C5 D5 D8 F2 F3 R57-R61 R63 R87 R106 R108 U24
ULTRA-SONIC SENSOR: J29

### Ports
3V3, GND, RS485/RS232/T (bidir, harness RS485/RS232/T), VCC

### Harnesses
RS485/RS232/T: RXD/RS485/RS232/T, RE/DE/RS485/T, TXD/RS485/RS232/T

### Nets
3V3: C5.2 R57.2 R58.2 R59.2 R60.2 R106.1 U24.8(VCC) ; port 3V3
GND: C5.1 D5.1(A) D8.1(A) J29.4 R61.2 U24.5(GND) ; port GND
VCC: J29.1 ; port VCC
RE/DE/RS485/T: R58.1 R59.1 U24.2(/RE) U24.3(DE) ; port RS485/RS232/T.RE/DE/RS485/T
RS485_N: F2.2 J29.2
RS485_P: F3.2 J29.3
RXD/RS485/RS232/T: R57.1 U24.1(RO) ; port RS485/RS232/T.RXD/RS485/RS232/T  [project net RS485/RS232/T.RXD/RS485/RS232/T]
TXD/RS485/RS232/T: R60.1 U24.4(DI) ; port RS485/RS232/T.TXD/RS485/RS232/T  [project net RS485/RS232/T.TXD/RS485/RS232/T]
NetD5_2: D5.2(K) F2.1 R63.2
NetD8_2: D8.2(K) F3.1 R87.2
NetR61_1: R61.1 R63.1 R108.1 U24.7(B)
NetR87_1: R87.1 R106.2 R108.2 U24.6(A)

### Layout directives
differential pair; net class RS485; differential pair class RS485_LINES; rule Impedance Constraint [Min = 115.0    Max = 120.0    ]; rule Matched Net Lengths [Tolerance = 0.508mm]: RS485_N, RS485_P

### Library data of the parts
C5 = GRM155R62A104KE14D: CAP CER 0.1UF 100V X5R 0402; Manufacturer: Murata; Capacitance: 100nF; Tolerance: 10%; Item Type: Capacitor; Supplier 1: Arrow Electronics; Manufacturer Part Number: GRM155R62A104KE14D; RoHS: Yes; Category: Ceramic Capacitors; Stock 1: 870000; Pricing 1: 10000=0.00500, 20000=0.00410, 30000=0.00390, 50000=0.00370, 100000=0.00300 (USD); Mount: Surface Mount; Case/Package: 0402; Case Code (Metric): 1005; Case Code (Imperial): 0402; Weight: 0.000212oz; Min Operating Temperature: -55°C; Max Operating Temperature: 85°C; Packaging: Tape and Reel; Voltage Rating: 100V; Dielectric: X5R; Termination: SMD/SMT; Voltage Rating (DC): 100V; Package Quantity: 10000; Series: GRM; Length: 0.039inch; Width: 0.02inch; Height: 0.5mm; Thickness: 0.022inch; Reach SVHC Compliant: Yes; Lead Free: Lead Free; RoHS Compliant: Yes; ComponentLink1URL: http://www.farnell.com/datasheets/2079151.pdf?src-supplier=Farnell; ComponentLink1Description: http://www.farnell.com/datasheets/2079151.pdf?src-supplier=Farnell; ComponentLink2URL: http://www.mouser.com/ds/2/281/c02e-2905.pdf?src-supplier=Mouser; ComponentLink2Description: http://www.mouser.com/ds/2/281/c02e-2905.pdf?src-supplier=Mouser; ComponentLink3URL: http://www.farnell.com/datasheets/2079151.pdf?src-supplier=Element14; ComponentLink3Description: http://www.farnell.com/datasheets/2079151.pdf?src-supplier=Element14; ComponentLink4URL: http://search.murata.co.jp/Ceramy/image/img/A01X/G101/ENG/GRM155R62A104KE14-01.pdf?src-supplier=Digi-Key; ComponentLink4Description: http://search.murata.co.jp/Ceramy/image/img/A01X/G101/ENG/GRM155R62A104KE14-01.pdf?src-supplier=Digi-Key; ComponentLink5URL: http://www.farnell.com/datasheets/2079151.pdf?src-supplier=Newark; ComponentLink5Description: http://www.farnell.com/datasheets/2079151.pdf?src-supplier=Newark; Supplier Part Number 1: GRM155R62A104KE14D; LCSC Part Number: C162178
D5 D8 = SMBJ26CA: SMB(DO-214AA) TVS ROHS; Manufacturer: MSKSEMI; Item Type: Diode; Manufacturer Part Number: SMBJ26CA; Package: SMB(DO-214AA); LCSC Part Number: C5331111; ComponentLink1Description: LCSC; ComponentLink1URL: https://www.lcsc.com/product-detail/TVS_MSKSEMI-SMBJ26CA_C5331111.html
F2 F3 = SMD0805P020TF: 9V 200mA 100A 500mA 0805 Resettable Fuses ROHS; Manufacturer: RUILON; Item Type: Fuse; Manufacturer Part Number: SMD0805P020TF; Package: 0805; LCSC Part Number: C20976; ComponentLink1Description: LCSC; ComponentLink1URL: https://www.lcsc.com/product-detail/Resettable-Fuses_RUILON-Shenzhen-Ruilongyuan-Elec-SMD0805P020TF_C20976.html
J29 = TBP01R1-508-04BE: TERMINAL BLOCK, PLUGGABLE, 5.08,; Manufacturer: CUI Devices; Supplier 1: Arrow Electronics; Manufacturer Part Number: TBP01R1-508-04BE; RoHS: Yes; Category: Terminal Blocks; Stock 1: 697; Pricing 1: 1=0.77380, 10=0.29040, 25=0.28750, 50=0.25070, 200=0.24820, 400=0.24580, 600=0.22570 (USD); Supplier Part Number 1: TBP01R1-508-04BE
R57-R61 R106 = RC0402FR-074K7L: RES 4.7K OHM 1% 1/16W 0402; Manufacturer: Yageo; Voltage Rating (DC): 50V; Power Rating: 62.5mW; Resistance: 4.7kR; Temperature Coefficient: 100ppm/°C; Max Power Dissipation: 63mW; Item Type: Resistor; Supplier 1: Avnet; Manufacturer Part Number: RC0402FR-074K7L; RoHS: Yes; Category: Chip SMD Resistors; Stock 1: 2420000; Pricing 1: 10000=0.00085 (USD); Case/Package: 0402; Number of Pins: 2; Case Code (Imperial): 0402; Case Code (Metric): 1005; Size Code: 0402; Min Operating Temperature: -55°C; Max Operating Temperature: 155°C; Tolerance: 1%; Voltage Rating: 50V; Packaging: Tape and Reel; Resistor Type: Thick Film; Termination: SMD/SMT; Features: Moisture Resistant; Series: RC; Number of Terminations: 2; Resistance Tolerance: 1%; Construction: Rectangular; Length: 1mm; Width: 0.5mm; Height: 0.32mm; Depth: 0.5mm; Height - Seated (Max): 0.016inch; RoHS Compliant: Yes; Reach SVHC Compliant: Yes; Military Standard: Not; Lead Free: Lead Free; ComponentLink1URL: https://datasheet.ciiva.com/22661/1686128-22661342.pdf?src-supplier=Element14; ComponentLink1Description: https://datasheet.ciiva.com/22661/1686128-22661342.pdf?src-supplier=Element14; ComponentLink2URL: https://datasheet.ciiva.com/7850/1018594-7850022.pdf?src-supplier=Element14; ComponentLink2Description: https://datasheet.ciiva.com/7850/1018594-7850022.pdf?src-supplier=Element14; ComponentLink3URL: https://datasheet.ciiva.com/7850/1018594-7850023.pdf?src-supplier=Element14; ComponentLink3Description: https://datasheet.ciiva.com/7850/1018594-7850023.pdf?src-supplier=Element14; ComponentLink4URL: https://datasheet.ciiva.com/15215/getdatasheetpartid-328119-15215035.pdf?src-supplier=Verical; ComponentLink4Description: https://datasheet.ciiva.com/15215/getdatasheetpartid-328119-15215035.pdf?src-supplier=Verical; Supplier Part Number 1: RC0402FR-074K7L; LCSC Part Number: C105871
R63 R87 = RCS040222R0FKED: RES SMD 22 OHM 1% 1/5W 0402; Manufacturer: Vishay Dale; Max Power Dissipation: 200mW; Temperature Coefficient: 100ppm/°C; Supplier 1: Digi-Key; Manufacturer Part Number: RCS040222R0FKED; Stock 1: 8456; Pricing 1: 1=0.12, 10=0.105, 100=0.0402, 1000=0.01771, 2500=0.0153, 5000=0.01368 (USD); Case/Package: 0402; Case Code (Metric): 1005; Case Code (Imperial): 0402; Min Operating Temperature: -55°C; Max Operating Temperature: 155°C; Packaging: Tape and Reel; Resistance: 22R; Resistor Type: Thick Film; Number of Terminations: 2; Tolerance: 1%; Features: Automotive AEC-Q200; Length: 0.039inch; Width: 0.02inch; Height: 0.016inch; RoHS Compliant: Yes; ComponentLink1URL: http://www.vishay.com/docs/20065/rcse3.pdf?src-supplier=Digi-Key; ComponentLink1Description: http://www.vishay.com/docs/20065/rcse3.pdf?src-supplier=Digi-Key; Supplier Part Number 1: 541-2880-1-ND; LCSC Part Number: C2086081
R108 = RC0603FR-07120RL: RES 120 OHM 1% 1/10W 0603; Manufacturer: Yageo; Temperature Coefficient: 100ppm/°C; Voltage Rating (DC): 50V; Power Rating: 100mW; Supplier 1: Digi-Key; Manufacturer Part Number: RC0603FR-07120RL; RoHS: Yes; Category: Chip SMD Resistors; Stock 1: 839061; Pricing 1: 1=0.10000, 10=0.02400, 100=0.00970, 1000=0.00436, 2500=0.00378 (USD); Case/Package: 0603; Number of Pins: 2; Case Code (Metric): 1608; Case Code (Imperial): 0603; Size Code: 0603; Min Operating Temperature: -55°C; Max Operating Temperature: 155°C; Resistance: 120R; Tolerance: 1%; Resistor Type: Thick Film; Packaging: Tape and Reel; Voltage Rating: 50V; Package Quantity: 1; Number of Terminations: 2; Termination: SMD/SMT; Max Power Dissipation: 100mW; Features: Moisture Resistant; Series: RC; Construction: Rectangular; Resistance Tolerance: 1%; Length: 1.6mm; Width: 0.031inch; Height: 0.022inch; Depth: 0.8mm; REACH SVHC: No SVHC; Lead Free: Lead Free; Military Standard: Not; RoHS Compliant: Yes; ComponentLink1URL: https://datasheet.ciiva.com/2553/pyu-r-int-thick-7-2553512.pdf?src-supplier=Digi-Key; ComponentLink1Description: https://datasheet.ciiva.com/2553/pyu-r-int-thick-7-2553512.pdf?src-supplier=Digi-Key; ComponentLink2URL: https://datasheet.ciiva.com/7746/443971-7746248.pdf?src-supplier=Element14; ComponentLink2Description: https://datasheet.ciiva.com/7746/443971-7746248.pdf?src-supplier=Element14; ComponentLink3URL: https://datasheet.ciiva.com/2553/pyu-r-int-thick-7-2553513.pdf?src-supplier=Digi-Key; ComponentLink3Description: https://datasheet.ciiva.com/2553/pyu-r-int-thick-7-2553513.pdf?src-supplier=Digi-Key; ComponentLink4URL: https://datasheet.ciiva.com/7746/443971-7746249.pdf?src-supplier=Element14; ComponentLink4Description: https://datasheet.ciiva.com/7746/443971-7746249.pdf?src-supplier=Element14; ComponentLink5URL: https://datasheet.ciiva.com/2553/pyu-r-int-thick-7-2553514.pdf?src-supplier=Digi-Key; ComponentLink5Description: https://datasheet.ciiva.com/2553/pyu-r-int-thick-7-2553514.pdf?src-supplier=Digi-Key; ComponentLink6URL: https://datasheet.ciiva.com/46395/443971-46395021.pdf?src-supplier=Element14; ComponentLink6Description: https://datasheet.ciiva.com/46395/443971-46395021.pdf?src-supplier=Element14; Supplier Part Number 1: 311-120HRCT-ND; LCSC Part Number: C114640
U24 = SP3485EIM/TR: SOP-8 RS-485/RS-422 ICs ROHS; Manufacturer: HGSEMI; Item Type: IC; Manufacturer Part Number: SP3485EIM/TR; Package: SOP-8; LCSC Part Number: C519086; ComponentLink1Description: LCSC; ComponentLink1URL: https://www.lcsc.com/product-detail/RS-485-RS-422-ICs_HGSEMI-SP3485EIM-TR_C519086.html